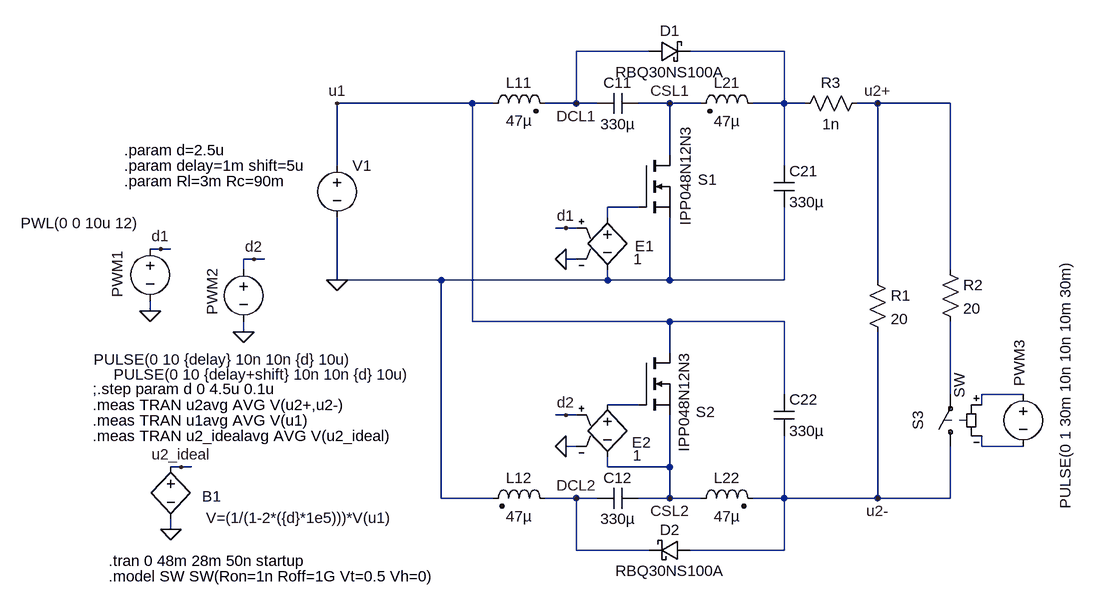
[diagram p0: schematic BC_Type4_nonideal_ccm_R_jump.asc]
BC_Type4_nonideal_ccm_R_jump.asc, the LTspice schematic file:
Version 4
SHEET 1 1540 1056
WIRE 416 80 304 80
WIRE 624 80 480 80
WIRE 144 160 -64 160
WIRE 176 160 144 160
WIRE 304 160 304 80
WIRE 304 160 256 160
WIRE 336 160 304 160
WIRE 448 160 400 160
WIRE 496 160 448 160
WIRE 624 160 624 80
WIRE 624 160 576 160
WIRE 656 160 624 160
WIRE 768 160 736 160
WIRE 880 160 768 160
WIRE 448 240 448 160
WIRE -64 256 -64 160
WIRE 624 256 624 160
WIRE 400 320 352 320
WIRE 352 336 352 320
WIRE 288 352 272 352
WIRE 304 352 288 352
WIRE -336 384 -352 384
WIRE -320 384 -336 384
WIRE -192 400 -208 400
WIRE -176 400 -192 400
WIRE 304 400 288 400
WIRE -208 416 -208 400
WIRE 880 416 880 160
WIRE -64 432 -64 336
WIRE 96 432 -64 432
WIRE 352 432 352 416
WIRE 352 432 96 432
WIRE 448 432 448 336
WIRE 448 432 352 432
WIRE 624 432 624 320
WIRE 624 432 448 432
WIRE 768 432 768 160
WIRE -352 480 -352 464
WIRE 144 496 144 160
WIRE 448 496 144 496
WIRE 624 496 448 496
WIRE -208 512 -208 496
WIRE 448 544 448 496
WIRE 624 608 624 496
WIRE 880 608 880 496
WIRE 992 608 928 608
WIRE 400 624 352 624
WIRE 928 624 928 608
WIRE 288 640 272 640
WIRE 304 640 288 640
WIRE 304 688 288 688
WIRE 928 688 928 672
WIRE 992 688 928 688
WIRE -304 720 -320 720
WIRE -288 720 -304 720
WIRE 352 720 352 704
WIRE 448 720 448 640
WIRE 448 720 352 720
WIRE 96 768 96 432
WIRE 176 768 96 768
WIRE 304 768 256 768
WIRE 336 768 304 768
WIRE 448 768 448 720
WIRE 448 768 400 768
WIRE 496 768 448 768
WIRE 624 768 624 672
WIRE 624 768 576 768
WIRE 768 768 768 512
WIRE 768 768 624 768
WIRE 880 768 880 688
WIRE 880 768 768 768
WIRE -320 816 -320 800
WIRE 304 848 304 768
WIRE 416 848 304 848
WIRE 624 848 624 768
WIRE 624 848 480 848
FLAG -64 432 0
FLAG -352 480 0
FLAG -208 512 0
FLAG -336 384 d1
FLAG -192 400 d2
FLAG 288 400 0
FLAG 288 352 d1
FLAG 288 688 0
FLAG 288 640 d2
FLAG 768 160 u2+
FLAG 768 768 u2-
FLAG -64 160 u1
FLAG 304 160 DCL1
FLAG 304 768 DCL2
FLAG -320 816 0
FLAG -304 720 u2_ideal
FLAG 448 768 CSL2
FLAG 448 160 CSL1
SYMBOL cap 400 144 R90
WINDOW 0 0 32 VBottom 2
WINDOW 3 32 32 VTop 2
SYMATTR InstName C11
SYMATTR Value 330µ
SYMATTR SpiceLine Rser={Rc}
SYMBOL ind2 592 176 M270
WINDOW 0 32 56 VTop 2
WINDOW 3 4 56 VBottom 2
SYMATTR InstName L21
SYMATTR Value 47µ
SYMATTR Type ind
SYMATTR SpiceLine Rser={Rl}
SYMBOL ind2 160 176 R270
WINDOW 0 32 56 VTop 2
WINDOW 3 5 56 VBottom 2
SYMATTR InstName L11
SYMATTR Value 47µ
SYMATTR Type ind
SYMATTR SpiceLine Rser={Rl}
SYMBOL cap 608 256 R0
SYMATTR InstName C21
SYMATTR Value 330µ
SYMATTR SpiceLine Rser={Rc}
SYMBOL cap 336 752 M90
WINDOW 0 0 32 VBottom 2
WINDOW 3 32 32 VTop 2
SYMATTR InstName C12
SYMATTR Value 330µ
SYMATTR SpiceLine Rser={Rc}
SYMBOL ind2 480 784 R270
WINDOW 0 32 56 VTop 2
WINDOW 3 4 56 VBottom 2
SYMATTR InstName L22
SYMATTR Value 47µ
SYMATTR Type ind
SYMATTR SpiceLine Rser={Rl}
SYMBOL ind2 272 784 M270
WINDOW 0 32 56 VTop 2
WINDOW 3 4 56 VBottom 2
SYMATTR InstName L12
SYMATTR Value 47µ
SYMATTR Type ind
SYMATTR SpiceLine Rser={Rl}
SYMBOL cap 608 608 R0
SYMATTR InstName C22
SYMATTR Value 330µ
SYMATTR SpiceLine Rser={Rc}
SYMBOL voltage -64 240 R0
WINDOW 123 0 0 Left 0
WINDOW 39 0 0 Left 0
WINDOW 3 -487 104 Left 2
SYMATTR Value PWL(0 0 10u 12)
SYMATTR InstName V1
SYMBOL res 752 416 R0
SYMATTR InstName R1
SYMATTR Value 20
SYMBOL nmos 400 240 R0
WINDOW 0 91 37 Left 2
WINDOW 3 72 109 VLeft 2
SYMATTR InstName S1
SYMATTR Value IPP048N12N3
SYMBOL nmos 400 544 R0
WINDOW 0 88 91 Left 2
WINDOW 3 70 153 VLeft 2
SYMATTR InstName S2
SYMATTR Value IPP048N12N3
SYMBOL schottky 480 864 M270
WINDOW 0 32 32 VTop 2
WINDOW 3 0 32 VBottom 2
SYMATTR InstName D2
SYMATTR Value RBQ30NS100A
SYMATTR Description Diode
SYMATTR Type diode
SYMBOL schottky 416 96 R270
WINDOW 0 32 32 VTop 2
WINDOW 3 0 32 VBottom 2
SYMATTR InstName D1
SYMATTR Value RBQ30NS100A
SYMATTR Description Diode
SYMATTR Type diode
SYMBOL voltage -352 368 R0
WINDOW 0 -35 55 VBottom 2
WINDOW 3 114 171 Top 2
WINDOW 123 0 0 Left 0
WINDOW 39 0 0 Left 0
SYMATTR InstName PWM1
SYMATTR Value PULSE(0 10 {delay} 10n 10n {d} 10u)
SYMBOL voltage -208 400 R0
WINDOW 0 -64 50 VTop 2
WINDOW 3 30 193 Bottom 2
WINDOW 123 0 0 Left 0
WINDOW 39 0 0 Left 0
SYMATTR InstName PWM2
SYMATTR Value PULSE(0 10 {delay+shift} 10n 10n {d} 10u)
SYMBOL e 352 320 R0
WINDOW 0 42 60 Left 2
WINDOW 3 40 80 Left 2
SYMATTR InstName E1
SYMATTR Value 1
SYMBOL e 352 608 R0
WINDOW 0 38 74 Left 2
WINDOW 3 39 94 Left 2
SYMATTR InstName E2
SYMATTR Value 1
SYMBOL bv -320 704 R0
WINDOW 0 48 61 Left 2
WINDOW 3 54 94 Left 2
SYMATTR InstName B1
SYMATTR Value V=(1/(1-2*({d}*1e5)))*V(u1)
SYMBOL sw 880 704 R180
WINDOW 0 50 41 VRight 2
WINDOW 3 -14 90 VRight 2
SYMATTR InstName S3
SYMBOL voltage 992 592 R0
WINDOW 0 10 -32 VBottom 2
WINDOW 3 49 0 VTop 2
WINDOW 123 0 0 Left 0
WINDOW 39 0 0 Left 0
SYMATTR InstName PWM3
SYMATTR Value PULSE(0 1 30m 10n 10n 10m 30m)
SYMBOL res 864 400 R0
SYMATTR InstName R2
SYMATTR Value 20
SYMBOL res 640 176 R270
WINDOW 0 32 56 VTop 2
WINDOW 3 0 56 VBottom 2
SYMATTR InstName R3
SYMATTR Value 1n
TEXT -392 280 Left 2 !.param Rl=3m Rc=90m
TEXT -392 232 Left 2 !.param d=2.5u
TEXT -416 864 Left 2 !.tran 0 48m 28m 50n startup
TEXT -440 600 Left 2 !;.step param d 0 4.5u 0.1u
TEXT -392 256 Left 2 !.param delay=1m shift=5u
TEXT -440 624 Left 2 !.meas TRAN u2avg AVG V(u2+,u2-)
TEXT -440 648 Left 2 !.meas TRAN u1avg AVG V(u1)
TEXT -440 672 Left 2 !.meas TRAN u2_idealavg AVG V(u2_ideal)
TEXT -416 888 Left 2 !.model SW SW(Ron=1n Roff=1G Vt=0.5 Vh=0)

The netlist it stands for:
* BC_Type4_nonideal_ccm_R_jump.asc
C11 CSL1 DCL1 330µ Rser={Rc}
L21 N001 CSL1 47µ Rser={Rl}
L11 u1 DCL1 47µ Rser={Rl}
C21 N001 0 330µ Rser={Rc}
C12 DCL2 CSL2 330µ Rser={Rc}
L22 CSL2 u2- 47µ Rser={Rl}
L12 DCL2 0 47µ Rser={Rl}
C22 u1 u2- 330µ Rser={Rc}
V1 u1 0 PWL(0 0 10u 12)
R1 u2+ u2- 20
M§S1 CSL1 N002 0 0 IPP048N12N3
M§S2 u1 N005 CSL2 CSL2 IPP048N12N3
D2 u2- DCL2 RBQ30NS100A
D1 DCL1 N001 RBQ30NS100A
V§PWM1 d1 0 PULSE(0 10 {delay} 10n 10n {d} 10u)
V§PWM2 d2 0 PULSE(0 10 {delay+shift} 10n 10n {d} 10u)
E1 N002 0 d1 0 1
E2 N005 CSL2 d2 0 1
B1 u2_ideal 0 V=(1/(1-2*({d}*1e5)))*V(u1)
S3 u2- N003 N004 N006 SW
V§PWM3 N004 N006 PULSE(0 1 30m 10n 10n 10m 30m)
R2 u2+ N003 20
R3 N001 u2+ 1n
.model D D
.lib standard.dio
.model NMOS NMOS
.model PMOS PMOS
.lib standard.mos
.param Rl=3m Rc=90m
.param d=2.5u
.tran 0 48m 28m 50n startup
;.step param d 0 4.5u 0.1u
.param delay=1m shift=5u
.meas TRAN u2avg AVG V(u2+,u2-)
.meas TRAN u1avg AVG V(u1)
.meas TRAN u2_idealavg AVG V(u2_ideal)
.model SW SW(Ron=1n Roff=1G Vt=0.5 Vh=0)
.backanno
.end